# Altium schematic sheet Audio.SchDoc
size A; SheetNumber: 2; SheetTotal: 5
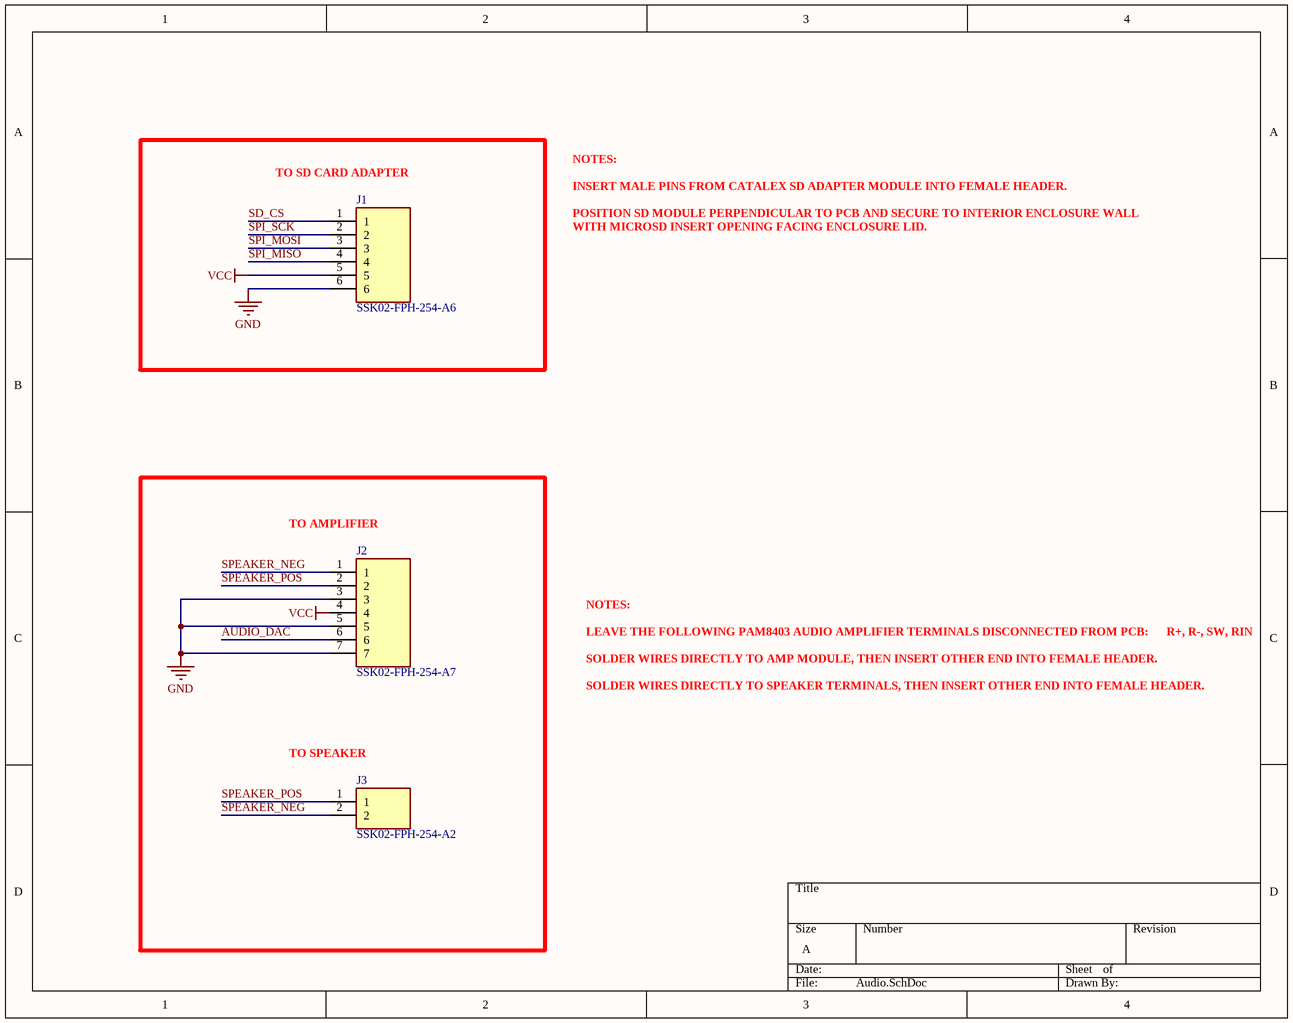
[diagram p0: Audio.SchDoc]

## Parts
J1  SSK02-FPH-254-A6  [SAMESKY_SSK02-FPH-254-A6]
J2  SSK02-FPH-254-A7  [SAMESKY_SSK02-FPH-254-A7]
J3  SSK02-FPH-254-A2  [SAMESKY_SSK02-FPH-254-A2]

## Blocks framed on the sheet
TO SD CARD ADAPTER: J1

## Nets
GND: J1.6 J2.3 J2.5 J2.7
VCC: J1.5 J2.4
AUDIO_DAC: J2.6
SD_CS: J1.1
SPEAKER_NEG: J2.1 J3.2
SPEAKER_POS: J2.2 J3.1
SPI_MISO: J1.4
SPI_MOSI: J1.3
SPI_SCK: J1.2

## Notes on the sheet
- NOTES:
- INSERT MALE PINS FROM CATALEX SD ADAPTER MODULE INTO FEMALE HEADER.
- POSITION SD MODULE PERPENDICULAR TO PCB AND SECURE TO INTERIOR ENCLOSURE WALL
- WITH MICROSD INSERT OPENING FACING ENCLOSURE LID.
- (near J2) TO AMPLIFIER
- LEAVE THE FOLLOWING PAM8403 AUDIO AMPLIFIER TERMINALS DISCONNECTED FROM PCB:
- R+, R-, SW, RIN
- SOLDER WIRES DIRECTLY TO AMP MODULE, THEN INSERT OTHER END INTO FEMALE HEADER.
- SOLDER WIRES DIRECTLY TO SPEAKER TERMINALS, THEN INSERT OTHER END INTO FEMALE HEADER.
- (near J3) TO SPEAKER

## Library data of the parts
J1 = SSK02-FPH-254-A6: 6 Position Header Connector 0.100 (2.54mm) Through Hole Gold; MF: Same Sky (Formerly CUI Devices); SnapEDA_Link: https://www.snapeda.com/parts/SSK02-FPH-254-A6/Same+Sky/view-part/?ref=snap; Package: None; Value: *; MP: SSK02-FPH-254-A6; Check_prices: https://www.snapeda.com/parts/SSK02-FPH-254-A6/Same+Sky/view-part/?ref=eda
J2 = SSK02-FPH-254-A7: MF: {'manufacturer': u'Same Sky (Formerly CUI Devices)'}; Package: None; Price: None; Value: *; MP: SSK02-FPH-254-A7; Availability: Unavailable
J3 = SSK02-FPH-254-A2: 2 Position Header Connector 0.100 (2.54mm) Through Hole Gold; MF: Same Sky (Formerly CUI Devices); SnapEDA_Link: https://www.snapeda.com/parts/SSK02-FPH-254-A2/Same+Sky/view-part/?ref=snap; Package: None; Value: *; MP: SSK02-FPH-254-A2; Check_prices: https://www.snapeda.com/parts/SSK02-FPH-254-A2/Same+Sky/view-part/?ref=eda